# Altium project ide_podule-8bit.PrjPcb
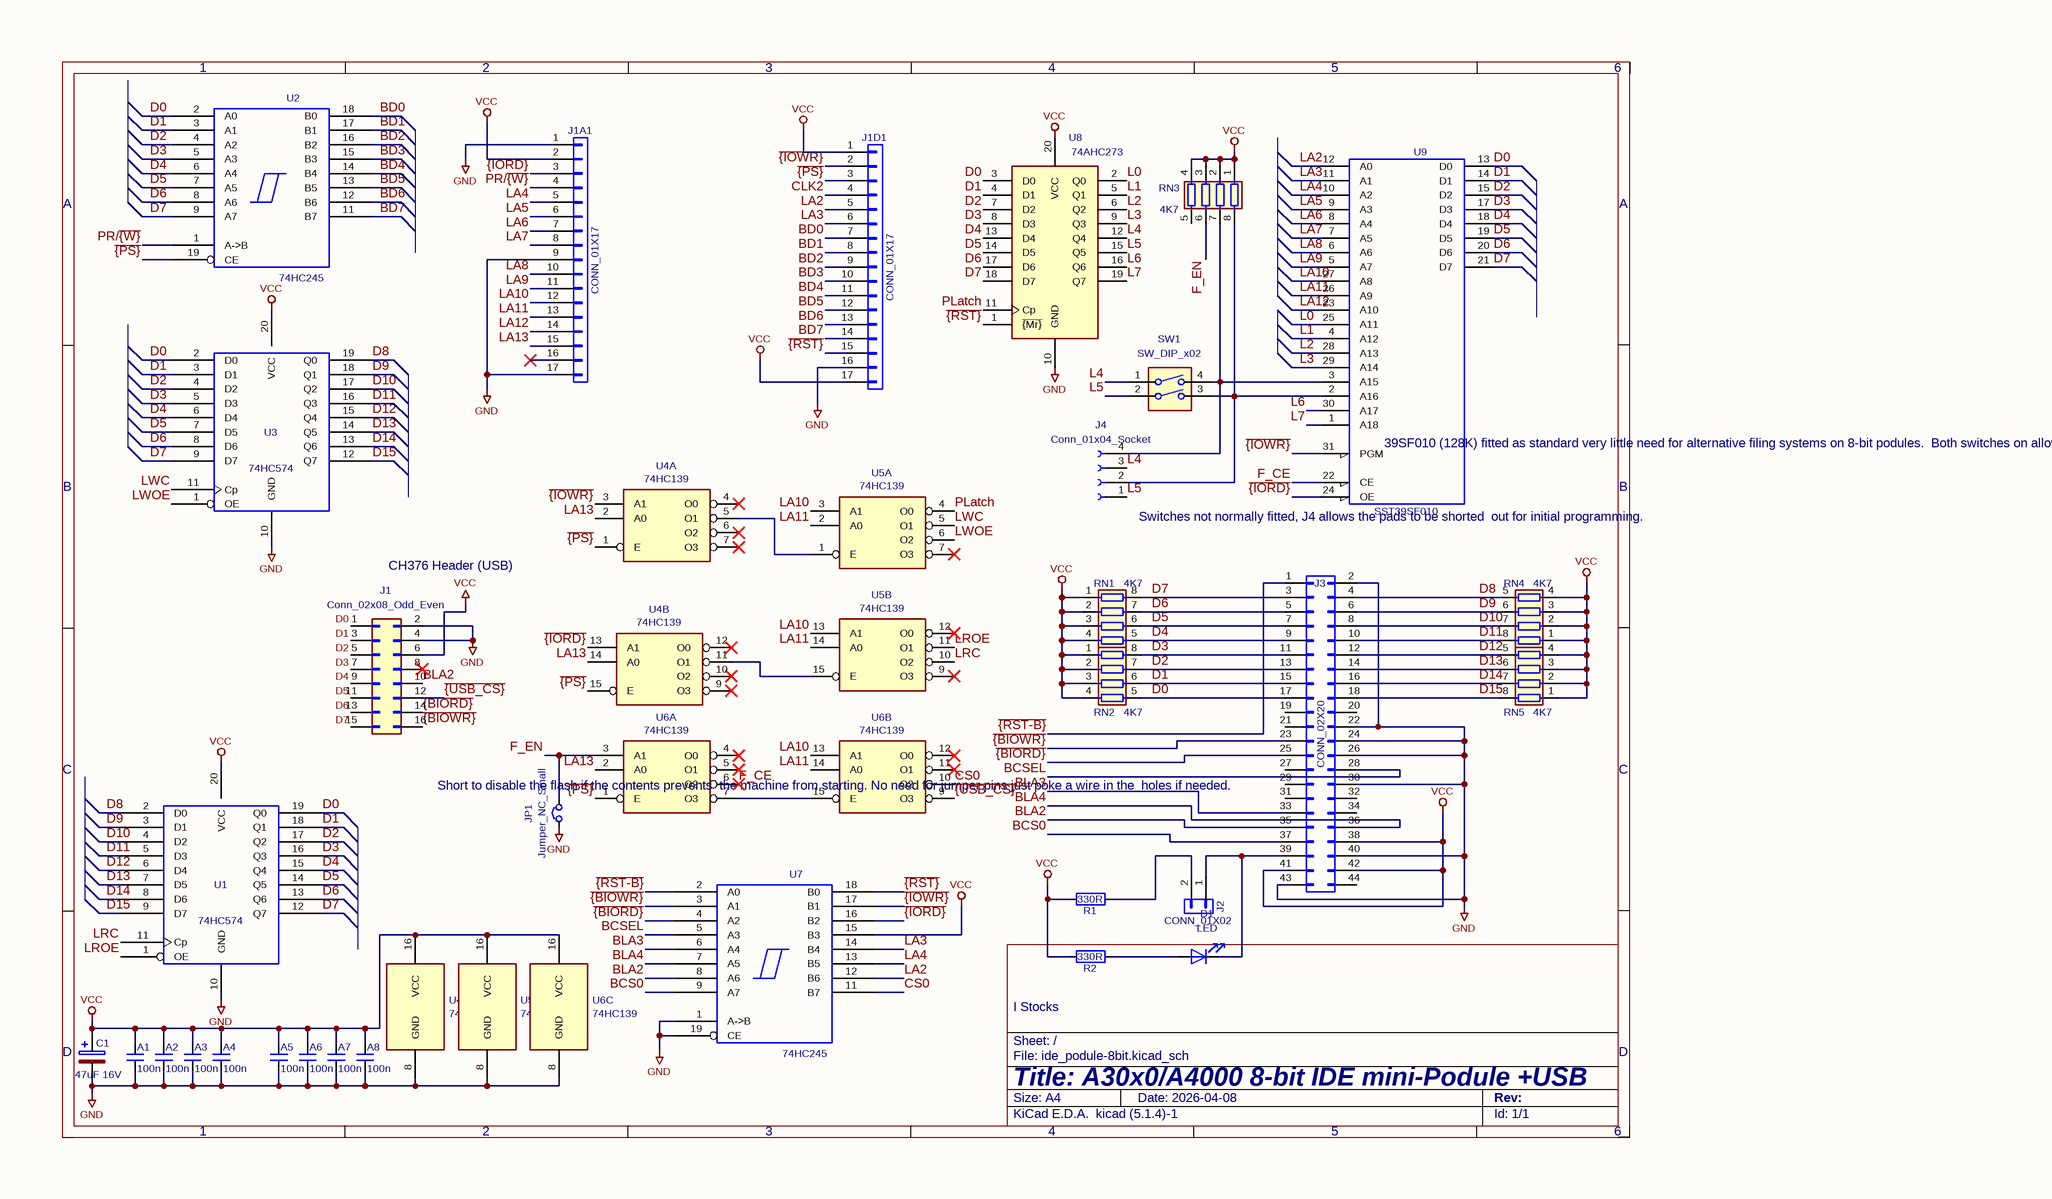
[diagram p0: ide_podule-8bit.SchDoc]
1 sheet, 34 parts. Net scope: global (net labels, ports and power ports of the same name join across sheets).
Board files: ide_podule-8bit.PcbDoc, ide_podule-8bit_horiz.PcbDoc

## Sheet ide_podule-8bit.SchDoc
size 297 x 209 mm

### Parts
A1  100n  [C_1206_3216Metric_Pad1.33x1.80mm_HandSolder]
A2  100n  [C_1206_3216Metric_Pad1.33x1.80mm_HandSolder]
A3  100n  [C_1206_3216Metric_Pad1.33x1.80mm_HandSolder]
A4  100n  [C_1206_3216Metric_Pad1.33x1.80mm_HandSolder]
A5  100n  [C_1206_3216Metric_Pad1.33x1.80mm_HandSolder]
A6  100n  [C_1206_3216Metric_Pad1.33x1.80mm_HandSolder]
A7  100n  [C_1206_3216Metric_Pad1.33x1.80mm_HandSolder]
A8  100n  [C_1206_3216Metric_Pad1.33x1.80mm_HandSolder]
C1  47uF 16V  [CP_EIA-6032-20_AVX-F_Pad2.25x2.35mm_HandSolder]
D1  LED  [LED_1206_3216Metric_Pad1.42x1.75mm_HandSolder]
J1  Conn_02x08_Odd_Even  [CH376-mod]
J1A1  CONN_01X17  [TSW-117-XX-YY-S]
J1D1  CONN_01X17  [TSW-117-XX-YY-S]
J2  CONN_01X02  [PinHeader_1x02_P2.54mm_Vertical]
J3  CONN_02X20  [SHDR44W55P200_2X22_4665X630X640P]
J4  Conn_01x04_Socket  [4 way edge]
JP1  Jumper_NC_Small  [PinHeader_1x02]
R1  330R  [R_1206_3216Metric_Pad1.30x1.75mm_HandSolder]
R2  330R  [R_1206_3216Metric_Pad1.30x1.75mm_HandSolder]
RN1  4K7  [R_Array_Concave_4x0603]
RN2  4K7  [R_Array_Concave_4x0603]
RN3  4K7  [R_Array_Concave_4x0603]
RN4  4K7  [R_Array_Concave_4x0603]
RN5  4K7  [R_Array_Concave_4x0603]
SW1  SW_DIP_x02  [DIP-4_W7.62mm_Socket]
U1  74HC574  [SOIC-20W_7.5x12.8mm_P1.27mm]
U2  74HC245  [SOIC-20W_7.5x12.8mm_P1.27mm]
U3  74HC574  [SOIC-20W_7.5x12.8mm_P1.27mm]
U4  74HC139  [SOIC-16_3.9x9.9mm_P1.27mm]  (parts A,B,C of 3)
U5  74HC139  [SOIC-16_3.9x9.9mm_P1.27mm]  (parts A,B,C of 3)
U6  74HC139  [SOIC-16_3.9x9.9mm_P1.27mm]  (parts A,B,C of 3)
U7  74HC245  [SOIC-20W_7.5x12.8mm_P1.27mm]
U8  value 74AHC273  [SOIC-20W_7.5x12.8mm_P1.27mm]  (hidden comment: 74HC273)
U9  SST39SF010  [PLCC-32_11.4x14.0mm_P1.27mm]

### Nets
GND: A1.2 A2.2 A3.2 A4.2 A5.2 A6.2 A7.2 A8.2 C1.2 J1.2(Pin_2) J1.4(Pin_4) J1A1.1(P1) J1A1.9(P9) J1A1.17(P17) J1D1.16(P16) J3.2(P2) J3.22(P22) J3.24(P24) J3.26(P26) J3.30(P30) J3.40(P40) J3.43(P43) JP1.1 U1.10(GND) U3.10(GND) U4.8(GND) U5.8(GND) U6.8(GND) U7.1(A->B) U7.19(CE) U8.10(GND)
VCC: A1.1 A2.1 A3.1 A4.1 A5.1 A6.1 A7.1 A8.1 C1.1 J1.6(Pin_6) J1A1.2(P2) J1D1.1(P1) J1D1.17(P17) J3.38(P38) J3.41(P41) J3.42(P42) R1.2 R2.2 RN1.1(R1.1) RN1.2(R2.1) RN1.3(R3.1) RN1.4(R4.1) RN2.1(R1.1) RN2.2(R2.1) RN2.3(R3.1) RN2.4(R4.1) RN3.1(R1.1) RN3.2(R2.1) RN3.3(R3.1) RN3.4(R4.1) RN4.1(R1.1) RN4.2(R2.1) RN4.3(R3.1) RN4.4(R4.1) RN5.1(R1.1) RN5.2(R2.1) RN5.3(R3.1) RN5.4(R4.1) U1.20(VCC) U3.20(VCC) U4.16(VCC) U5.16(VCC) U6.16(VCC) U7.15(B3) U8.20(VCC)
BCS0: J3.37(P37) U7.9(A7)
BCSEL: J3.28(P28) U7.5(A3)
BD0: J1D1.7(P7) U2.18(B0)
BD1: J1D1.8(P8) U2.17(B1)
BD2: J1D1.9(P9) U2.16(B2)
BD3: J1D1.10(P10) U2.15(B3)
BD4: J1D1.11(P11) U2.14(B4)
BD5: J1D1.12(P12) U2.13(B5)
BD6: J1D1.13(P13) U2.12(B6)
BD7: J1D1.14(P14) U2.11(B7)
BLA2: J1.10(Pin_10) J3.35(P35) U7.8(A6)
BLA3: J3.33(P33) U7.6(A4)
BLA4: J3.36(P36) U7.7(A5)
CLK2: J1D1.4(P4)
CS0: U6.10(O2) U7.11(B7)
D0: J1.1(Pin_1) J3.17(P17) RN2.5(R4.2) U1.19(Q0) U2.2(A0) U3.2(D0) U8.3(D0) U9.13(D0)
D1: J1.3(Pin_3) J3.15(P15) RN2.6(R3.2) U1.18(Q1) U2.3(A1) U3.3(D1) U8.4(D1) U9.14(D1)
D2: J1.5(Pin_5) J3.13(P13) RN2.7(R2.2) U1.17(Q2) U2.4(A2) U3.4(D2) U8.7(D2) U9.15(D2)
D3: J1.7(Pin_7) J3.11(P11) RN2.8(R1.2) U1.16(Q3) U2.5(A3) U3.5(D3) U8.8(D3) U9.17(D3)
D4: J1.9(Pin_9) J3.9(P9) RN1.5(R4.2) U1.15(Q4) U2.6(A4) U3.6(D4) U8.13(D4) U9.18(D4)
D5: J1.11(Pin_11) J3.7(P7) RN1.6(R3.2) U1.14(Q5) U2.7(A5) U3.7(D5) U8.14(D5) U9.19(D5)
D6: J1.13(Pin_13) J3.5(P5) RN1.7(R2.2) U1.13(Q6) U2.8(A6) U3.8(D6) U8.17(D6) U9.20(D6)
D7: J1.15(Pin_15) J3.3(P3) RN1.8(R1.2) U1.12(Q7) U2.9(A7) U3.9(D7) U8.18(D7) U9.21(D7)
D8: J3.4(P4) RN4.5(R4.2) U1.2(D0) U3.19(Q0)
D9: J3.6(P6) RN4.6(R3.2) U1.3(D1) U3.18(Q1)
D10: J3.8(P8) RN4.7(R2.2) U1.4(D2) U3.17(Q2)
D11: J3.10(P10) RN4.8(R1.2) U1.5(D3) U3.16(Q3)
D12: J3.12(P12) RN5.5(R4.2) U1.6(D4) U3.15(Q4)
D13: J3.14(P14) RN5.6(R3.2) U1.7(D5) U3.14(Q5)
D14: J3.16(P16) RN5.7(R2.2) U1.8(D6) U3.13(Q6)
D15: J3.18(P18) RN5.8(R1.2) U1.9(D7) U3.12(Q7)
F_CE: U6.6(O2) U9.22(CE)
F_EN: JP1.2 RN3.6(R3.2) U6.3(A1)
L0: U8.2(Q0) U9.25(A11)
L1: U8.5(Q1) U9.4(A12)
L2: U8.6(Q2) U9.28(A13)
L3: U8.9(Q3) U9.29(A14)
L4: J4.3(Pin_3) SW1.1 U8.12(Q4)
L5: J4.1(Pin_1) SW1.2 U8.15(Q5)
L6: U8.16(Q6) U9.30(A17)
L7: U8.19(Q7) U9.1(A18)
LA2: J1D1.5(P5) U7.12(B6) U9.12(A0)
LA3: J1D1.6(P6) U7.14(B4) U9.11(A1)
LA4: J1A1.5(P5) U7.13(B5) U9.10(A2)
LA5: J1A1.6(P6) U9.9(A3)
LA6: J1A1.7(P7) U9.8(A4)
LA7: J1A1.8(P8) U9.7(A5)
LA8: J1A1.10(P10) U9.6(A6)
LA9: J1A1.11(P11) U9.5(A7)
LA10: J1A1.12(P12) U5.3(A1) U5.13(A1) U6.13(A1) U9.27(A8)
LA11: J1A1.13(P13) U5.2(A0) U5.14(A0) U6.14(A0) U9.26(A9)
LA12: J1A1.14(P14) U9.23(A10)
LA13: J1A1.15(P15) U4.2(A0) U4.14(A0) U6.2(A0)
LRC: U1.11(Cp) U5.10(O2)
LROE: U1.1(OE) U5.11(O1)
LWC: U3.11(Cp) U5.5(O1)
LWOE: U3.1(OE) U5.6(O2)
PLatch: U5.4(O0) U8.11(Cp)
PR/~{{W}}: J1A1.4(P4) U2.1(A->B)
~{{BIORD}}: J1.14(Pin_14) J3.25(P25) U7.4(A2)
~{{BIOWR}}: J1.16(Pin_16) J3.23(P23) U7.3(A1)
~{{IORD}}: J1A1.3(P3) U4.13(A1) U7.16(B2) U9.24(OE)
~{{IOWR}}: J1D1.2(P2) U4.3(A1) U7.17(B1) U9.31(PGM)
~{{PS}}: J1D1.3(P3) U2.19(CE) U4.1(E) U4.15(E) U6.1(E)
~{{RST-B}}: J3.1(P1) U7.2(A0)
~{{RST}}: J1D1.15(P15) U7.18(B0) U8.1(~{{Mr}})
~{{USB_CS}}: J1.12(Pin_12) U6.9(O3)
NetD1_1: D1.1(K) J2.1(P1) J3.39(P39)
NetD1_2: D1.2(A) R2.1
NetJ2_2: J2.2(P2) R1.1
NetJ4_2: J4.2(Pin_2) RN3.8(R1.2) SW1.3 U9.2(A16)
NetJ4_4: J4.4(Pin_4) RN3.7(R2.2) SW1.4 U9.3(A15)
NetU4_5: U4.5(O1) U5.1(E)
NetU4_11: U4.11(O1) U5.15(E)
NetU6_7: U6.7(O3) U6.15(E)

Not connected (* = marked no-connect by the designer): J1 8(Pin_8)*; J1A1 16(P16)*; J3 19(P19) 20(P20) 21(P21) 27(P27) 29(P29) 31(P31) 32(P32) 34(P34) 44(P44); RN3 5(R4.2); U2 10(GND) 20(VCC); U4 4(O0)* 6(O2)* 7(O3)* 9(O3)* 10(O2)* 12(O0)*; U5 7(O3)* 9(O3)* 12(O0)*; U6 4(O0)* 5(O1)* 11(O1)* 12(O0)*; U7 10(GND) 20(VCC); U9 16(GND) 32(VCC)

### Notes on the sheet
- (near U9) 39SF010 (128K) fitted as standard
  very little need for alternative
  filing systems on 8-bit podules.
  Both switches on allow the full
  128K to be used, or treat as
  4 x 32K section for alternative
  filing systems.
  39SF010 only goes up to A16.
- CH376 Header (USB)
- (near U9) Switches not normally fitted,
  J4 allows the pads to be shorted
  out for initial programming.
- Short to disable the flash
  if the contents prevents
  the machine from starting.
  No need for jumper pins
  just poke a wire in the
  holes if needed.
- 1
- 2
- 3
- 4
- 5
- 6
- A
- B
- C
- I Stocks
- D
- Title: A30x0/A4000 8-bit IDE mini-Podule +USB
- File: ide_podule-8bit.kicad_sch
- Sheet: /
- KiCad E.D.A.  kicad (5.1.4)-1
- Size: A4
- Date: 2026-04-08
- Rev:
- Id: 1/1

### Library data of the parts
A1-A8 = C_Small: Value: 100n; Footprint: Capacitor_SMD:C_1206_3216Metric_Pad1.33x1.80mm_HandSolder
C1 = CP: Value: 47uF 16V; Footprint: Capacitor_Tantalum_SMD:CP_EIA-6032-20_AVX-F_Pad2.25x2.35mm_HandSolder
J3 = CONN_02X22: Value: CONN_02X20; Footprint: Connector_PinHeader_2.00mm:PinHeader_2x22_P2.00mm_Vertical
JP1 = Jumper_NC_Small-Device: Value: Jumper_NC_Small; Footprint: econet:PinHeader_1x02
R1 R2 = R: Value: 330R; Footprint: Resistor_SMD:R_1206_3216Metric_Pad1.30x1.75mm_HandSolder
RN1-RN5 = R_Pack04: Value: 4K7; Footprint: Resistor_SMD:R_Array_Concave_4x0603
U1 U3 = 74HCT574_PWR: Value: 74HC574; Footprint: Package_SO:SOIC-20W_7.5x12.8mm_P1.27mm
U4-U6 = 74LS139: Value: 74HC139; Footprint: Package_SO:SOIC-16_3.9x9.9mm_P1.27mm
U8 = 74AHC273: Footprint: Package_SO:SOIC-20W_7.5x12.8mm_P1.27mm
U9 = SST39SF040: Value: SST39SF010; Footprint: Package_LCC:PLCC-32_11.4x14.0mm_P1.27mm
D1 = LED: Value: LED; Footprint: LED_SMD:LED_1206_3216Metric_Pad1.42x1.75mm_HandSolder
J1 = Conn_02x08_Odd_Even: Value: Conn_02x08_Odd_Even; Footprint: Library:CH376-mod
J1A1 J1D1 = CONN_01X17: Value: CONN_01X17; Footprint: Connector_PinHeader_2.54mm:PinHeader_1x17_P2.54mm_Vertical
J2 = CONN_01X02: Value: CONN_01X02; Footprint: Connector_PinHeader_2.54mm:PinHeader_1x02_P2.54mm_Vertical
J4 = Conn_01x04_Socket: Value: Conn_01x04_Socket; Footprint: Library:4 way edge
SW1 = SW_DIP_x02: Value: SW_DIP_x02; Footprint: Package_DIP:DIP-4_W7.62mm_Socket
U2 U7 = 74HC245: Value: 74HC245; Footprint: Package_SO:SOIC-20W_7.5x12.8mm_P1.27mm